# Altium schematic sheet Input.SchDoc
size A; SheetNumber: 3; SheetTotal: 6
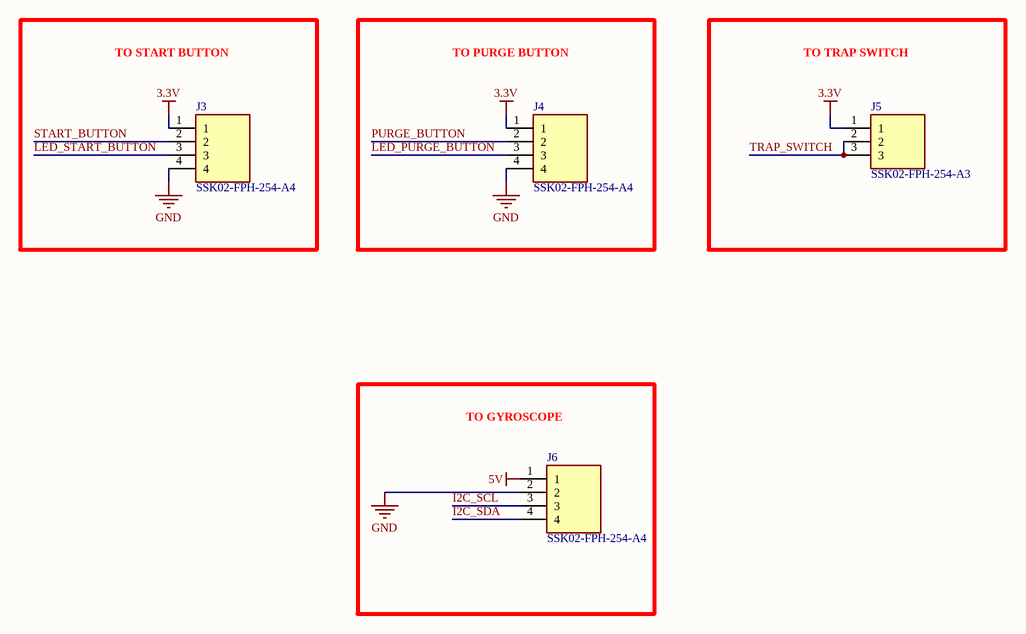
[diagram p0: Input.SchDoc]

## Parts
J3  SSK02-FPH-254-A4  [SAMESKY_SSK02-FPH-254-A4]
J4  SSK02-FPH-254-A4  [SAMESKY_SSK02-FPH-254-A4]
J5  SSK02-FPH-254-A3  [SAMESKY_SSK02-FPH-254-A3]
J6  SSK02-FPH-254-A4  [SAMESKY_SSK02-FPH-254-A4]

## Blocks framed on the sheet
TO START BUTTON: J3
TO PURGE BUTTON: J4
TO TRAP SWITCH: J5
TO GYROSCOPE: J6

## Nets
3.3V: J3.1 J4.1 J5.1
5V: J6.1
GND: J3.4 J4.4 J6.2
I2C_SCL: J6.3
I2C_SDA: J6.4
LED_PURGE_BUTTON: J4.3
LED_START_BUTTON: J3.3
PURGE_BUTTON: J4.2
START_BUTTON: J3.2
TRAP_SWITCH: J5.2 J5.3

## Library data of the parts
J3 J4 J6 = SSK02-FPH-254-A4: 4 Position Header Connector 0.100 (2.54mm) Through Hole Gold; MF: Same Sky (Formerly CUI Devices); SnapEDA_Link: https://www.snapeda.com/parts/SSK02-FPH-254-A4/Same+Sky/view-part/?ref=snap; Package: None; Value: *; MP: SSK02-FPH-254-A4; Check_prices: https://www.snapeda.com/parts/SSK02-FPH-254-A4/Same+Sky/view-part/?ref=eda
J5 = SSK02-FPH-254-A3: 2.54MM FEMALE HEADER 1X3PIN, Y T; MF: Same Sky (Formerly CUI Devices); SnapEDA_Link: https://www.snapeda.com/parts/SSK02-FPH-254-A3/Same+Sky/view-part/?ref=snap; Package: None; Value: *; MP: SSK02-FPH-254-A3; Check_prices: https://www.snapeda.com/parts/SSK02-FPH-254-A3/Same+Sky/view-part/?ref=eda